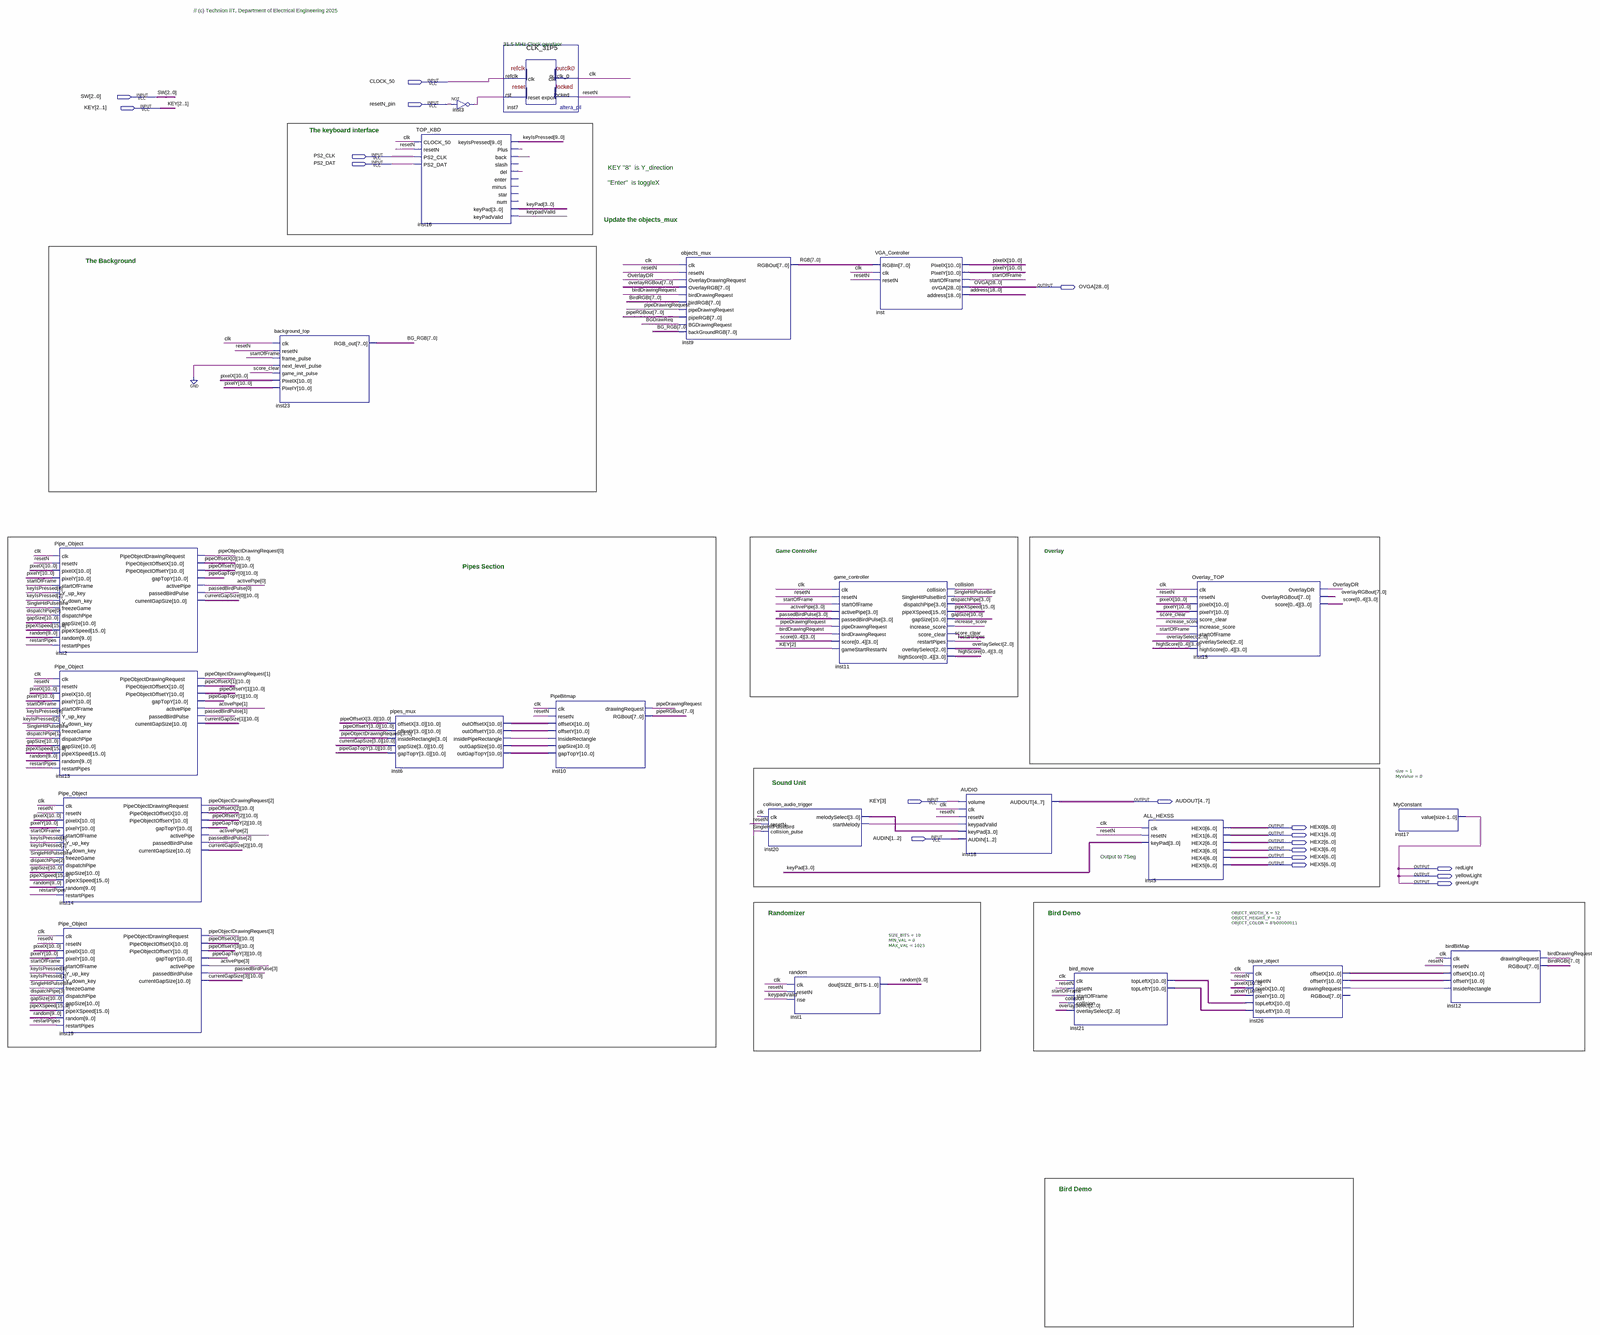
[diagram p0: schematic sheet, whole]
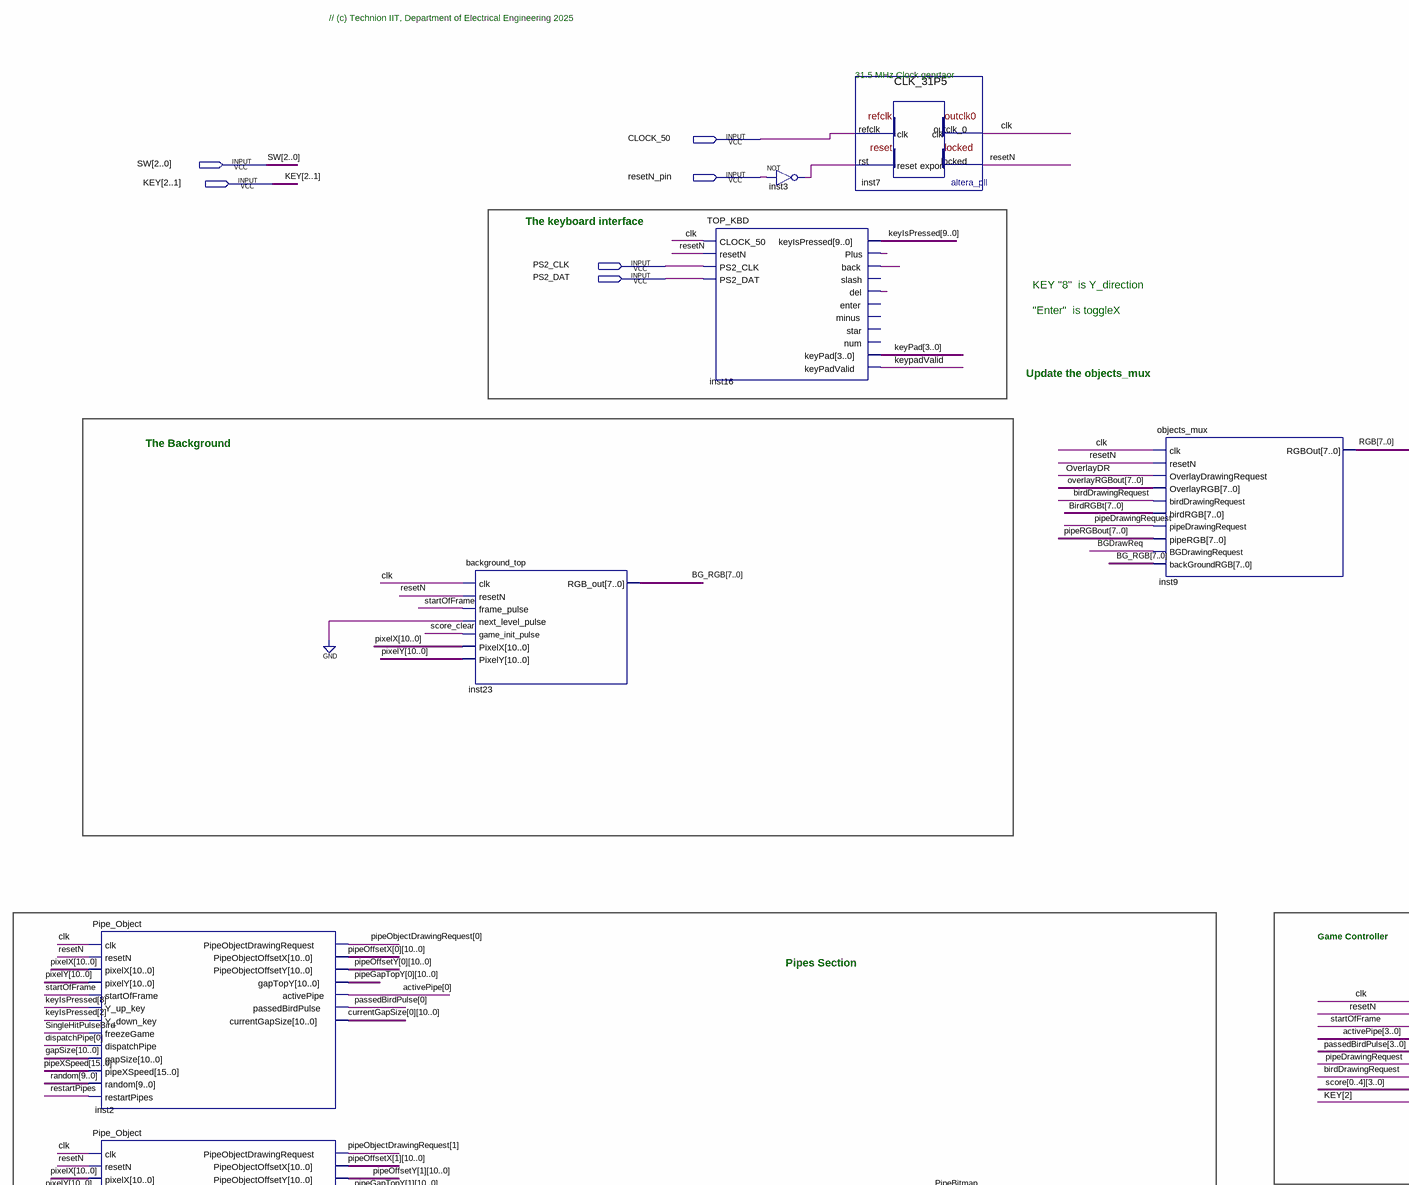
[diagram p1: schematic sheet, upper left part]
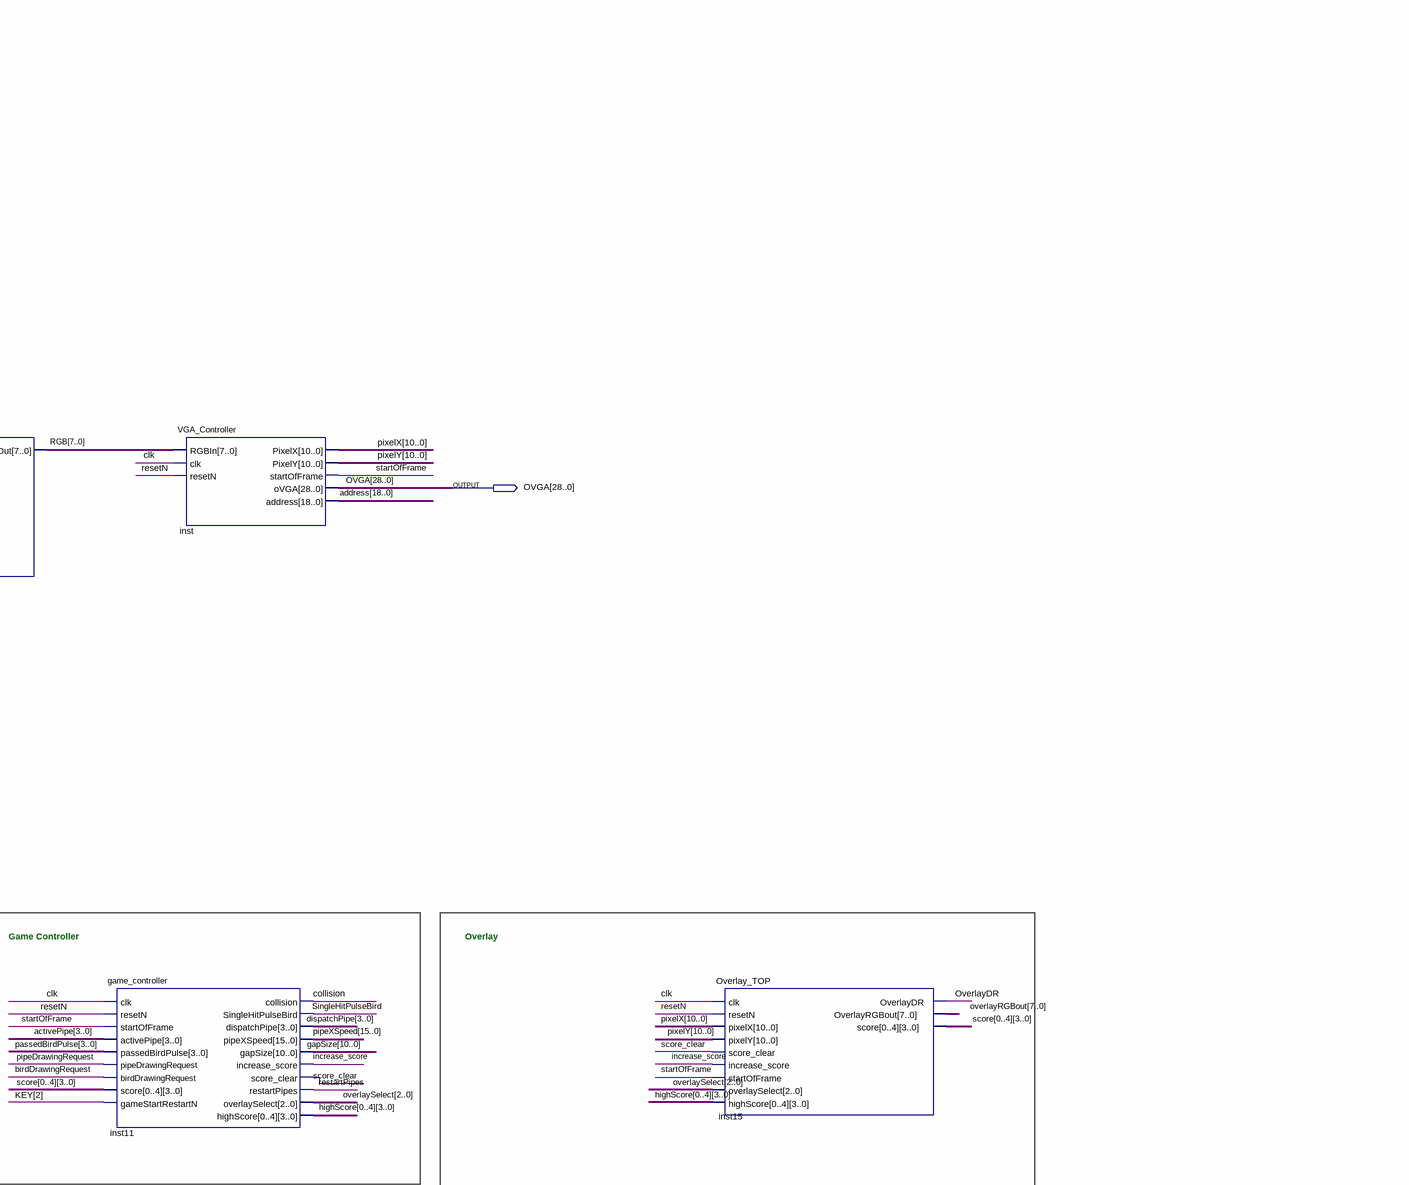
[diagram p2: schematic sheet, upper right part]
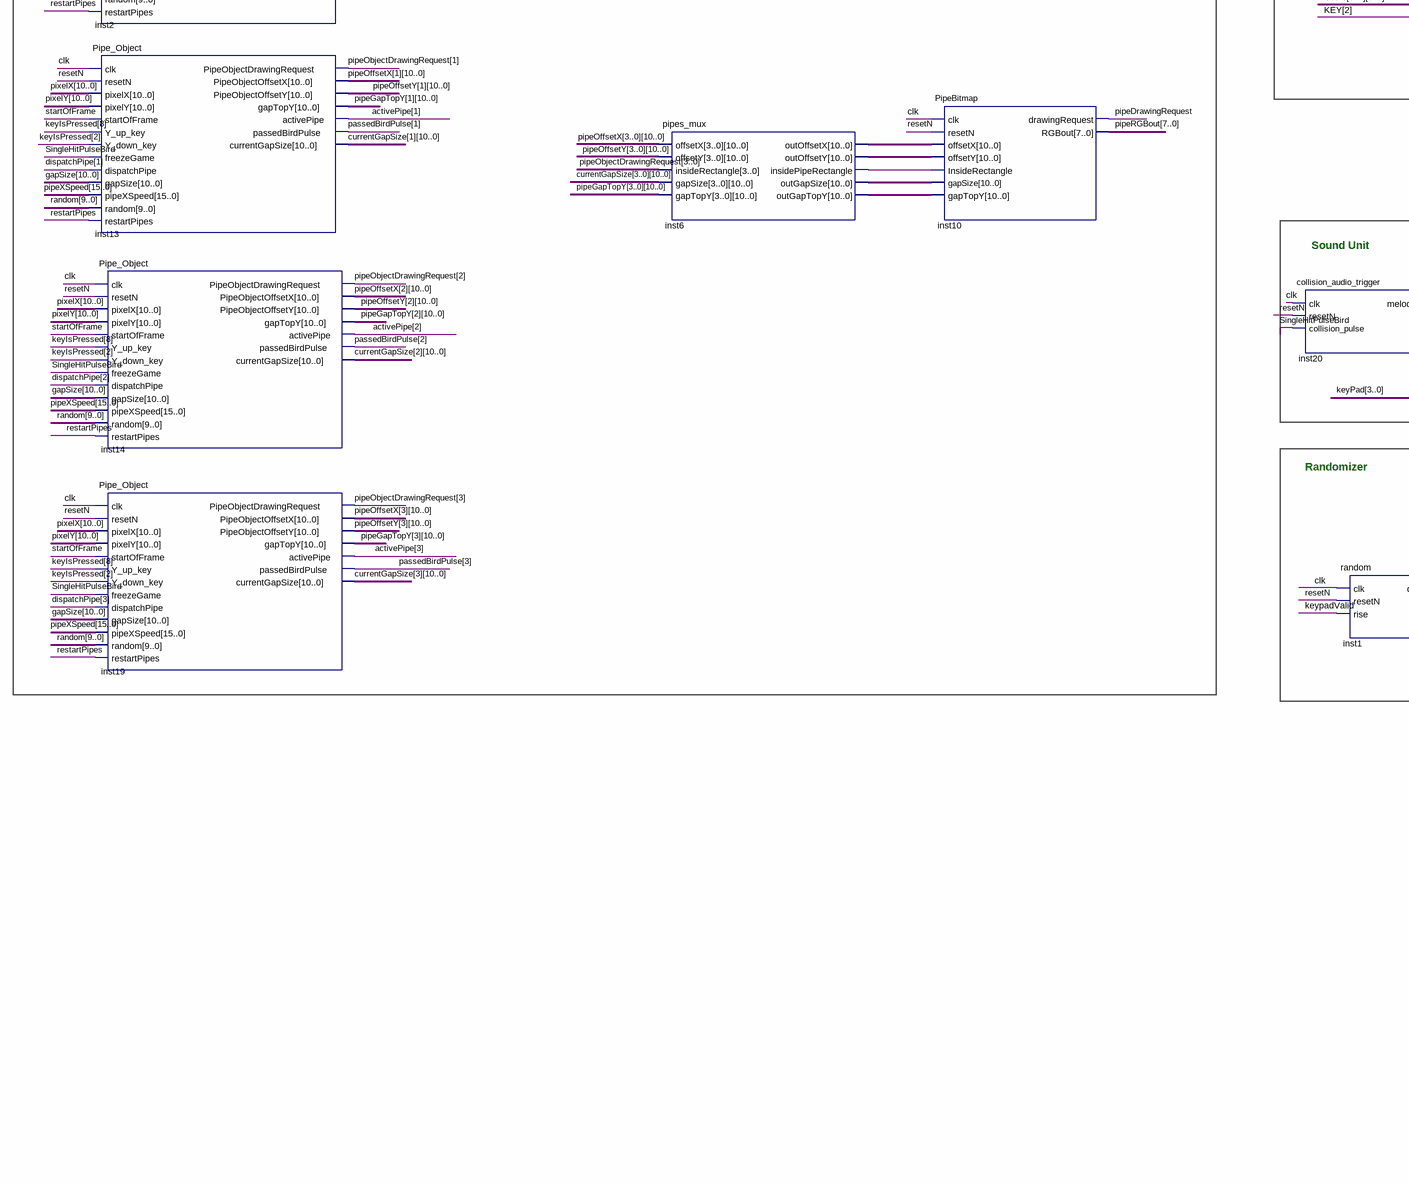
[diagram p3: schematic sheet, lower left part]
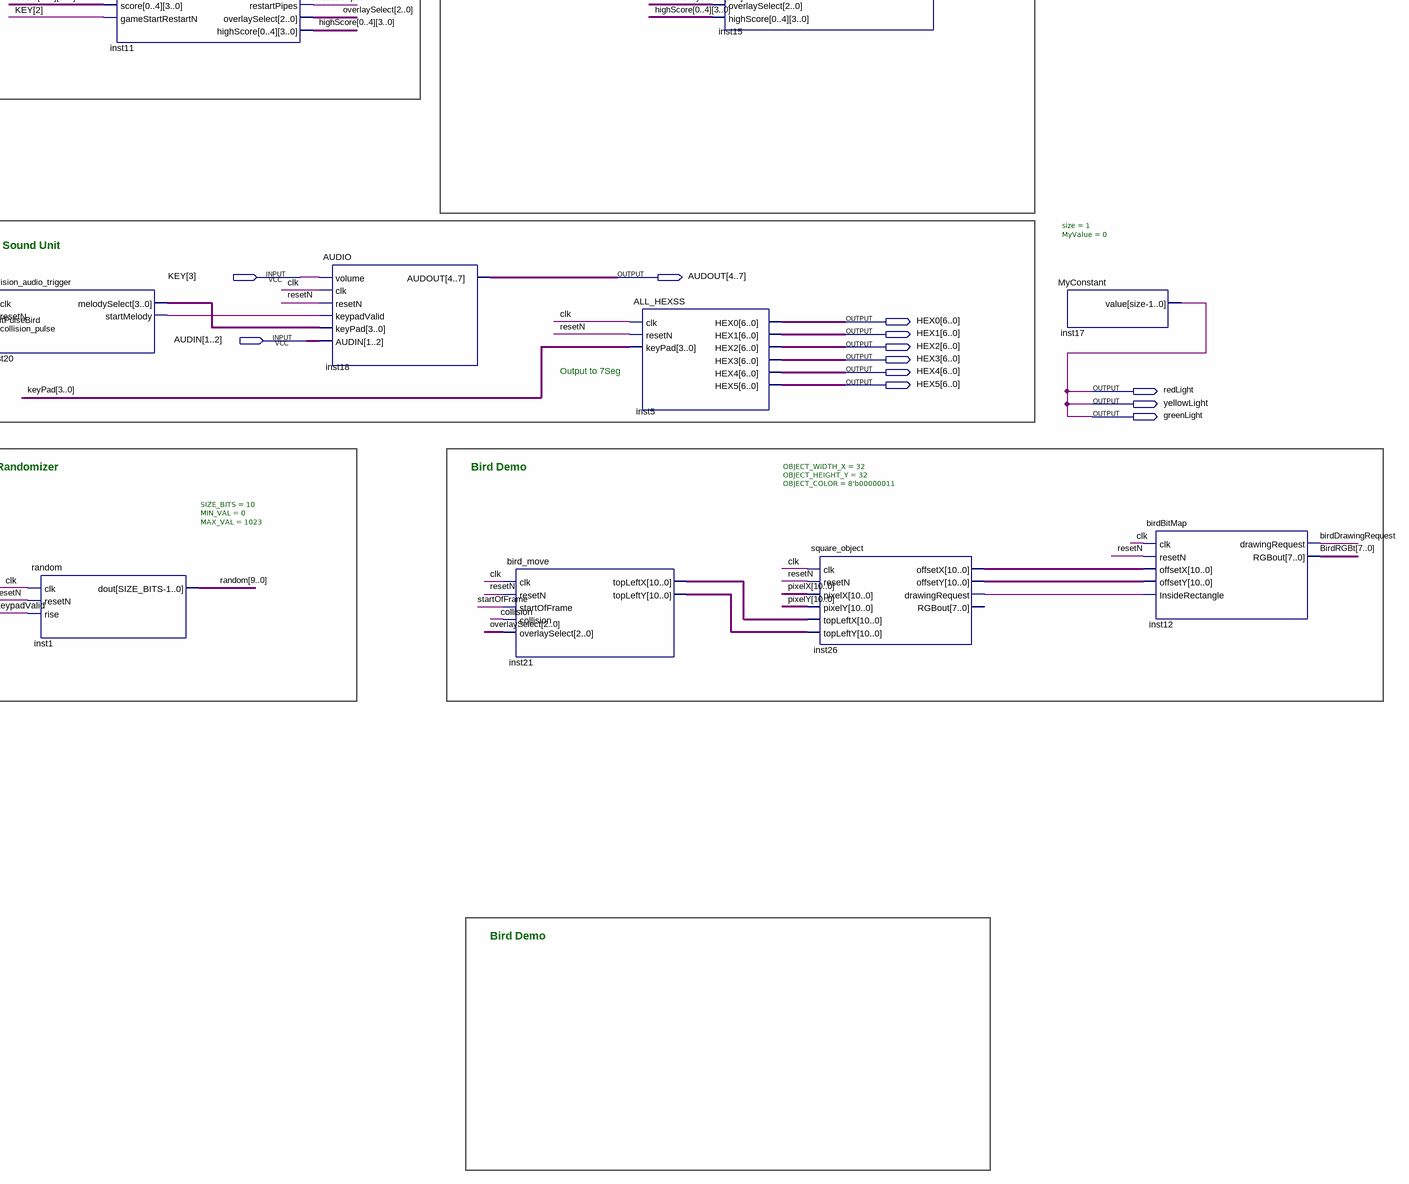
[diagram p4: schematic sheet, lower right part]
// Quartus schematic TOP_FLAPPY_BIRD.bdf as structural Verilog: 22 symbols, 19 pins
module TOP_FLAPPY_BIRD (
  input  CLOCK_50,
  input  [2:0] SW,
  input  resetN_pin,
  input  [3:1] KEY,
  input  PS2_CLK,
  input  PS2_DAT,
  input  [1:2] AUDIN,
  output [28:0] OVGA,
  output [4:7] AUDOUT,
  output [6:0] HEX0,
  output [6:0] HEX1,
  output [6:0] HEX2,
  output [6:0] HEX3,
  output [6:0] HEX4,
  output [6:0] HEX5,
  output redLight,
  output yellowLight,
  output greenLight
);

  wire BGDrawReq, birdDrawingRequest, clk, collision, increase_score, inst3_out, inst6_insidepiperectangle,
       inst16_back, inst16_del, inst16_plus, inst20_startmelody, inst26_drawingrequest, keypadValid,
       OverlayDR, pipeDrawingRequest, resetN, restartPipes, score_clear, SingleHitPulseBird, startOfFrame;
  wire [2:0] overlaySelect;
  wire [3:0] activePipe, dispatchPipe, highScore_0, highScore_1, highScore_2, highScore_3, highScore_4,
       inst20_melodyselect, keyPad, passedBirdPulse, pipeObjectDrawingRequest, score_0, score_1, score_2,
       score_3, score_4;
  wire [7:0] BG_RGB, BirdRGBt, overlayRGBout, pipeRGBout, RGB;
  wire [9:0] keyIsPressed, random;
  wire [10:0] currentGapSize_0, currentGapSize_1, currentGapSize_2, currentGapSize_3, gapSize,
       inst6_outgapsize, inst6_outgaptopy, inst6_outoffsetx, inst6_outoffsety, inst21_topleftx,
       inst21_toplefty, inst26_offsetx, inst26_offsety, pipeGapTopY_0, pipeGapTopY_1, pipeGapTopY_2,
       pipeGapTopY_3, pipeOffsetX_0, pipeOffsetX_1, pipeOffsetX_2, pipeOffsetX_3, pipeOffsetY_0,
       pipeOffsetY_1, pipeOffsetY_2, pipeOffsetY_3, pixelX, pixelY;
  wire [15:0] pipeXSpeed;
  wire [18:0] address;

  Pipe_Object inst2 (
    .clk(clk), .resetN(resetN), .pixelX(pixelX), .pixelY(pixelY), .startOfFrame(startOfFrame),
    .Y_up_key(keyIsPressed[8]), .Y_down_key(keyIsPressed[2]), .freezeGame(SingleHitPulseBird),
    .dispatchPipe(dispatchPipe[0]), .gapSize(gapSize), .pipeXSpeed(pipeXSpeed), .random(random),
    .restartPipes(restartPipes), .PipeObjectDrawingRequest(pipeObjectDrawingRequest[0]),
    .PipeObjectOffsetX(pipeOffsetX_0), .PipeObjectOffsetY(pipeOffsetY_0), .gapTopY(pipeGapTopY_0),
    .activePipe(activePipe[0]), .passedBirdPulse(passedBirdPulse[0]), .currentGapSize(currentGapSize_0));
  Pipe_Object inst13 (
    .clk(clk), .resetN(resetN), .pixelX(pixelX), .pixelY(pixelY), .startOfFrame(startOfFrame),
    .Y_up_key(keyIsPressed[8]), .Y_down_key(keyIsPressed[2]), .freezeGame(SingleHitPulseBird),
    .dispatchPipe(dispatchPipe[1]), .gapSize(gapSize), .pipeXSpeed(pipeXSpeed), .random(random),
    .restartPipes(restartPipes), .PipeObjectDrawingRequest(pipeObjectDrawingRequest[1]),
    .PipeObjectOffsetX(pipeOffsetX_1), .PipeObjectOffsetY(pipeOffsetY_1), .gapTopY(pipeGapTopY_1),
    .activePipe(activePipe[1]), .passedBirdPulse(passedBirdPulse[1]), .currentGapSize(currentGapSize_1));
  Pipe_Object inst14 (
    .clk(clk), .resetN(resetN), .pixelX(pixelX), .pixelY(pixelY), .startOfFrame(startOfFrame),
    .Y_up_key(keyIsPressed[8]), .Y_down_key(keyIsPressed[2]), .freezeGame(SingleHitPulseBird),
    .dispatchPipe(dispatchPipe[2]), .gapSize(gapSize), .pipeXSpeed(pipeXSpeed), .random(random),
    .restartPipes(restartPipes), .PipeObjectDrawingRequest(pipeObjectDrawingRequest[2]),
    .PipeObjectOffsetX(pipeOffsetX_2), .PipeObjectOffsetY(pipeOffsetY_2), .gapTopY(pipeGapTopY_2),
    .activePipe(activePipe[2]), .passedBirdPulse(passedBirdPulse[2]), .currentGapSize(currentGapSize_2));
  Pipe_Object inst19 (
    .clk(clk), .resetN(resetN), .pixelX(pixelX), .pixelY(pixelY), .startOfFrame(startOfFrame),
    .Y_up_key(keyIsPressed[8]), .Y_down_key(keyIsPressed[2]), .freezeGame(SingleHitPulseBird),
    .dispatchPipe(dispatchPipe[3]), .gapSize(gapSize), .pipeXSpeed(pipeXSpeed), .random(random),
    .restartPipes(restartPipes), .PipeObjectDrawingRequest(pipeObjectDrawingRequest[3]),
    .PipeObjectOffsetX(pipeOffsetX_3), .PipeObjectOffsetY(pipeOffsetY_3), .gapTopY(pipeGapTopY_3),
    .activePipe(activePipe[3]), .passedBirdPulse(passedBirdPulse[3]), .currentGapSize(currentGapSize_3));
  background_top inst23 (
    .clk(clk), .resetN(resetN), .frame_pulse(startOfFrame), .next_level_pulse(1'b0),
    .game_init_pulse(score_clear), .PixelX(pixelX), .PixelY(pixelY), .RGB_out(BG_RGB));
  pipes_mux inst6 (
    .offsetX({pipeOffsetX_3, pipeOffsetX_2, pipeOffsetX_1, pipeOffsetX_0}),
    .offsetY({pipeOffsetY_3, pipeOffsetY_2, pipeOffsetY_1, pipeOffsetY_0}),
    .insideRectangle(pipeObjectDrawingRequest),
    .gapSize({currentGapSize_3, currentGapSize_2, currentGapSize_1, currentGapSize_0}),
    .gapTopY({pipeGapTopY_3, pipeGapTopY_2, pipeGapTopY_1, pipeGapTopY_0}), .outOffsetX(inst6_outoffsetx),
    .outOffsetY(inst6_outoffsety), .insidePipeRectangle(inst6_insidepiperectangle),
    .outGapSize(inst6_outgapsize), .outGapTopY(inst6_outgaptopy));
  TOP_KBD inst16 (
    .CLOCK_50(clk), .resetN(resetN), .PS2_CLK(PS2_CLK), .PS2_DAT(PS2_DAT), .keyIsPressed(keyIsPressed),
    .Plus(inst16_plus), .back(inst16_back), .del(inst16_del), .keyPad(keyPad), .keyPadValid(keypadValid));  // open: slash, enter, minus, star, num
  not inst3 (inst3_out, resetN_pin);
  CLK_31P5 inst7 (.refclk(CLOCK_50), .rst(inst3_out), .outclk_0(clk), .locked(resetN));
  PipeBitmap inst10 (
    .clk(clk), .resetN(resetN), .offsetX(inst6_outoffsetx), .offsetY(inst6_outoffsety),
    .InsideRectangle(inst6_insidepiperectangle), .gapSize(inst6_outgapsize), .gapTopY(inst6_outgaptopy),
    .drawingRequest(pipeDrawingRequest), .RGBout(pipeRGBout));
  objects_mux inst9 (
    .clk(clk), .resetN(resetN), .OverlayDrawingRequest(OverlayDR), .OverlayRGB(overlayRGBout),
    .birdDrawingRequest(birdDrawingRequest), .birdRGB(BirdRGBt), .pipeDrawingRequest(pipeDrawingRequest),
    .pipeRGB(pipeRGBout), .BGDrawingRequest(BGDrawReq), .backGroundRGB(BG_RGB), .RGBOut(RGB));
  collision_audio_trigger inst20 (
    .clk(clk), .resetN(resetN), .collision_pulse(SingleHitPulseBird), .melodySelect(inst20_melodyselect),
    .startMelody(inst20_startmelody));
  random #(.SIZE_BITS(10), .MIN_VAL(0), .MAX_VAL(1023)) inst1 (
    .clk(clk), .resetN(resetN), .rise(keypadValid), .dout(random));
  game_controller inst11 (
    .clk(clk), .resetN(resetN), .startOfFrame(startOfFrame), .activePipe(activePipe),
    .passedBirdPulse(passedBirdPulse), .pipeDrawingRequest(pipeDrawingRequest),
    .birdDrawingRequest(birdDrawingRequest), .score({score_0, score_1, score_2, score_3, score_4}),
    .gameStartRestartN(KEY[2]), .collision(collision), .SingleHitPulseBird(SingleHitPulseBird),
    .dispatchPipe(dispatchPipe), .pipeXSpeed(pipeXSpeed), .gapSize(gapSize), .increase_score(increase_score),
    .score_clear(score_clear), .restartPipes(restartPipes), .overlaySelect(overlaySelect),
    .highScore({highScore_0, highScore_1, highScore_2, highScore_3, highScore_4}));
  VGA_Controller inst (
    .RGBIn(RGB), .clk(clk), .resetN(resetN), .PixelX(pixelX), .PixelY(pixelY), .startOfFrame(startOfFrame),
    .oVGA(OVGA), .address(address));
  AUDIO inst18 (
    .volume(KEY[3]), .clk(clk), .resetN(resetN), .keypadValid(inst20_startmelody),
    .keyPad(inst20_melodyselect), .AUDIN(AUDIN), .AUDOUT(AUDOUT));
  bird_move inst21 (
    .clk(clk), .resetN(resetN), .startOfFrame(startOfFrame), .collision(collision),
    .overlaySelect(overlaySelect), .topLeftX(inst21_topleftx), .topLeftY(inst21_toplefty));
  ALL_HEXSS inst5 (
    .clk(clk), .resetN(resetN), .keyPad(keyPad), .HEX0(HEX0), .HEX1(HEX1), .HEX2(HEX2), .HEX3(HEX3),
    .HEX4(HEX4), .HEX5(HEX5));
  Overlay_TOP inst15 (
    .clk(clk), .resetN(resetN), .pixelX(pixelX), .pixelY(pixelY), .score_clear(score_clear),
    .increase_score(increase_score), .startOfFrame(startOfFrame), .overlaySelect(overlaySelect),
    .highScore({highScore_0, highScore_1, highScore_2, highScore_3, highScore_4}), .OverlayDR(OverlayDR),
    .OverlayRGBout(overlayRGBout), .score({score_0, score_1, score_2, score_3, score_4}));
  square_object #(.OBJECT_WIDTH_X(32), .OBJECT_HEIGHT_Y(32), .OBJECT_COLOR(8'b00000011)) inst26 (
    .clk(clk), .resetN(resetN), .pixelX(pixelX), .pixelY(pixelY), .topLeftX(inst21_topleftx),
    .topLeftY(inst21_toplefty), .offsetX(inst26_offsetx), .offsetY(inst26_offsety),
    .drawingRequest(inst26_drawingrequest));  // open: RGBout
  MyConstant #(.size(1), .MyValue(0)) inst17 (.value(greenLight));
  birdBitMap inst12 (
    .clk(clk), .resetN(resetN), .offsetX(inst26_offsetx), .offsetY(inst26_offsety),
    .InsideRectangle(inst26_drawingrequest), .drawingRequest(birdDrawingRequest), .RGBout(BirdRGBt));

  assign redLight = greenLight;
  assign yellowLight = greenLight;

  // Notes on the sheet:
  //   // (c) Technion IIT, Department of Electrical Engineering 2025
  //   31.5 MHz Clock genrtaor
  //   The keyboard interface
  //   KEY "8"  is Y_direction
  //   "Enter"  is toggleX
  //   Update the objects_mux
  //   The Background
  //   Game Controller
  //   Overlay
  //   Pipes Section
  //   Sound Unit
  //   Output to 7Seg
  //   Randomizer
  //   Bird Demo
  //   Bird Demo
endmodule
